# EAGLE design rp2040zero_display_encoder (EAGLE 6.2)
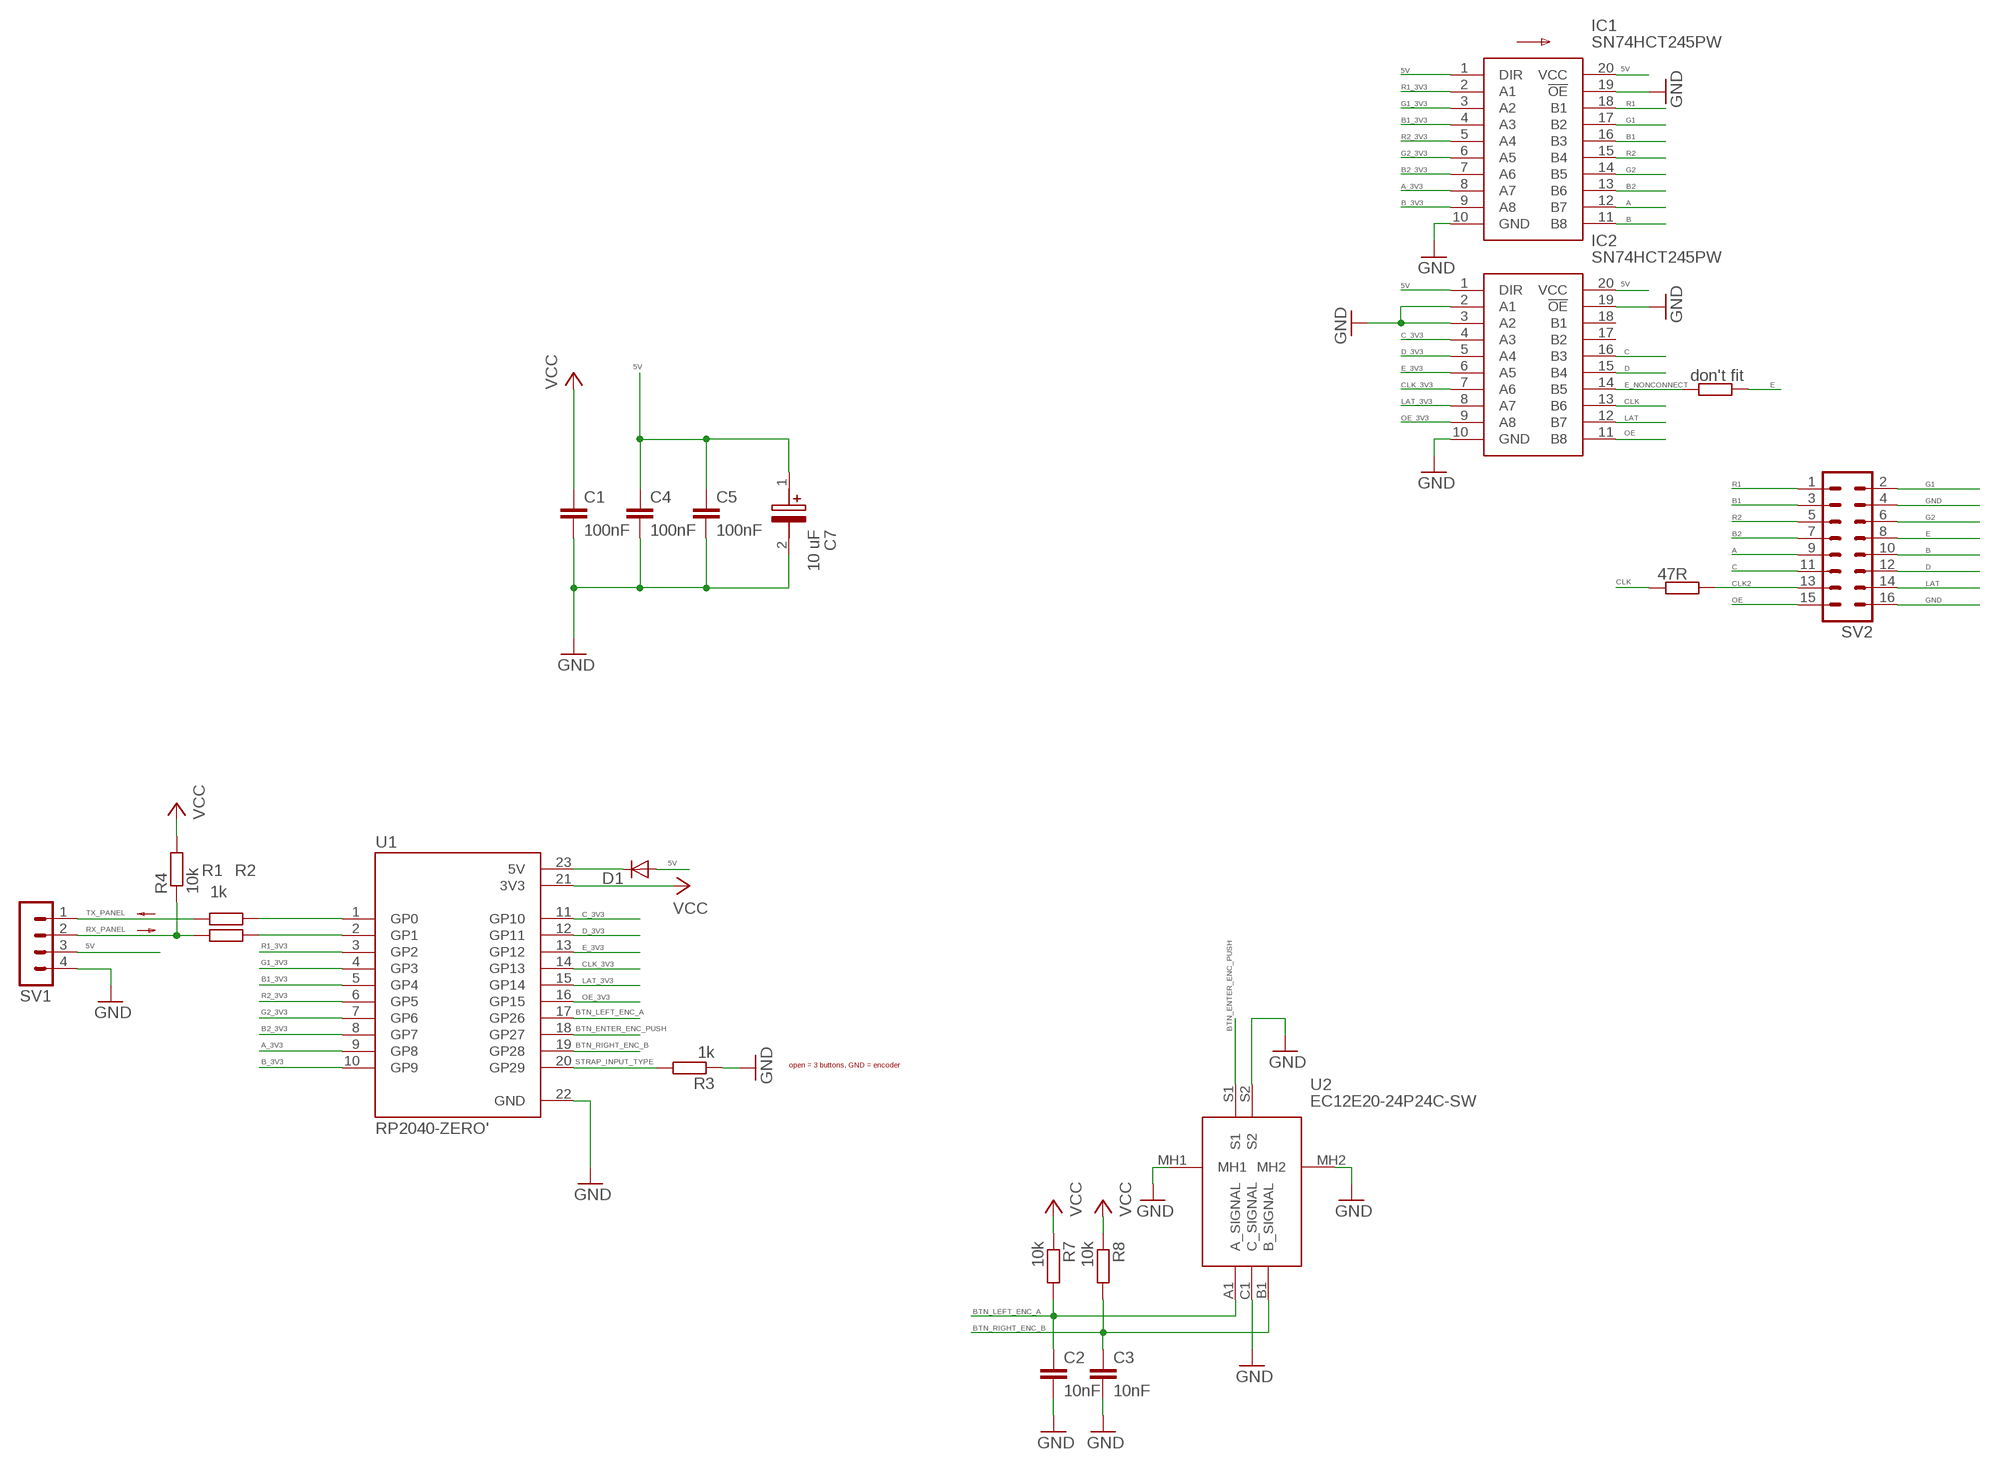
[diagram p0: schematic, sheet 1]

## Parts
C1  100nF  C-EUC0603  [C0603]
C2  10nF  C-EUC0603  [C0603]
C3  10nF  C-EUC0603  [C0603]
C4  100nF  C-EUC0603  [C0603]
C5  100nF  C-EUC0603  [C0603]
C7  10 uF  293D106X9016B2TE3  [CAPPM3528X210N]
D1  SK110-DIO  DIODE-DO214AC  [DO214AC]
IC1  SN74HCT245PW  [SOP65P640X120-20N]
IC2  SN74HCT245PW  [SOP65P640X120-20N]
R1  1k  R-EU_R0603  [R0603]
R2  1k  R-EU_R0603  [R0603]
R3  1k  R-EU_R0603  [R0603]
R4  10k  R-EU_R0603  [R0603]
R5  don't fit  R-EU_R0603  [R0603]
R6  47R  R-EU_R0603  [R0603]
R7  10k  R-EU_R0603  [R0603]
R8  10k  R-EU_R0603  [R0603]
SV1  MA04-1  [MA04-1]
SV2  ML16  [ML16]
U1  RP2040-ZERO'  [MODULE_RP2040-ZERO]
U2  EC12E20-24P24C-SW  [EC12E2024P24CSW]

## Nets
5V: C4.1 C5.1 C7.1(+) D1.A IC1.1(DIR) IC1.20(VCC) IC2.1(DIR) IC2.20(VCC) SV1.3
A: IC1.12(B7) SV2.9
A_3V3: IC1.8(A7) U1.9(GP8)
B: IC1.11(B8) SV2.10
B1: IC1.16(B3) SV2.3
B1_3V3: IC1.4(A3) U1.5(GP4)
B2: IC1.13(B6) SV2.7
B2_3V3: IC1.7(A6) U1.8(GP7)
B_3V3: IC1.9(A8) U1.10(GP9)
BTN_ENTER_ENC_PUSH: U1.18(GP27) U2.S1
BTN_LEFT_ENC_A: C2.1 R7.2 U1.17(GP26) U2.A1(A_SIGNAL)
BTN_RIGHT_ENC_B: C3.1 R8.2 U1.19(GP28) U2.B1(B_SIGNAL)
C: IC2.16(B3) SV2.11
C_3V3: IC2.4(A3) U1.11(GP10)
CLK: IC2.13(B6) R6.1
CLK2: R6.2 SV2.13
CLK_3V3: IC2.7(A6) U1.14(GP13)
D: IC2.15(B4) SV2.12
D_3V3: IC2.5(A4) U1.12(GP11)
E: R5.2 SV2.8
E_3V3: IC2.6(A5) U1.13(GP12)
E_NONCONNECT: IC2.14(B5) R5.1
G1: IC1.17(B2) SV2.2
G1_3V3: IC1.3(A2) U1.4(GP3)
G2: IC1.14(B5) SV2.6
G2_3V3: IC1.6(A5) U1.7(GP6)
GND: C1.2 C2.2 C3.2 C4.2 C5.2 C7.2(-) IC1.10(GND) IC1.19(!OE) IC2.2(A1) IC2.3(A2) IC2.10(GND) IC2.19(!OE) R3.1 SV1.4 SV2.4 SV2.16 U1.22(GND) U2.C1(C_SIGNAL) U2.MH1 U2.MH2 U2.S2
LAT: IC2.12(B7) SV2.14
LAT_3V3: IC2.8(A7) U1.15(GP14)
N$1: R1.2 U1.1(GP0)
N$2: R2.2 U1.2(GP1)
N$3: D1.C U1.23(5V)
OE: IC2.11(B8) SV2.15
OE_3V3: IC2.9(A8) U1.16(GP15)
R1: IC1.18(B1) SV2.1
R1_3V3: IC1.2(A1) U1.3(GP2)
R2: IC1.15(B4) SV2.5
R2_3V3: IC1.5(A4) U1.6(GP5)
RX_PANEL: R2.1 R4.1 SV1.2
STRAP_INPUT_TYPE: R3.2 U1.20(GP29)
TX_PANEL: R1.1 SV1.1
VCC: C1.1 R4.2 R7.1 R8.1 U1.21(3V3)
Unconnected: IC2.17(B2) IC2.18(B1)

## Notes on the sheet
- open = 3 buttons, GND = encoder

## Library data of the parts
C1-C5 = rcl:C-EU: CAPACITOR, European symbol
C7 = 293D106X9016B2TE3:293D106X9016B2TE3: Solid Tantalum Surface Mount Chip Capacitors TANTAMOUNT(TM), Molded Case, Standard Industrial Grade Source: Datasheet <http://www.vishay.com/docs/40002/293d.pdf>; DESCRIPTION: Solid Tantalum Surface Mount Chip Capacitors TANTAMOUNT(TM), Molded Case, Standard Industrial Grade; HEIGHT: 2.1mm; MANUFACTURER_NAME: Vishay; MANUFACTURER_PART_NUMBER: 293D106X9016B2TE3
D1 = diode:DIODE-: DIODE
IC1 IC2 = SN74HCT245PW:SN74HCT245PW: Texas Instruments SN74HCT245PW, Bus Transceiver, 8-Bit Non-Inverting CMOS, 5V, 20-Pin TSSOP Source: Datasheet <http://www.ti.com/lit/gpn/sn74hct245>; DESCRIPTION: Texas Instruments SN74HCT245PW, Bus Transceiver, 8-Bit Non-Inverting CMOS, 5V, 20-Pin TSSOP; HEIGHT: 1.2mm; MANUFACTURER_NAME: Texas Instruments; MANUFACTURER_PART_NUMBER: SN74HCT245PW
R1-R8 = resistor:R-EU_: RESISTOR, European symbol
SV1 = con-lstb:MA04-1: PIN HEADER; OC_FARNELL: unknown; OC_NEWARK: unknown
SV2 = con-ml:ML16: HARTING; OC_FARNELL: unknown; OC_NEWARK: unknown
U1 = RP2040-ZERO:RP2040-ZERO: Check availability <https://pricing.snapeda.com/parts/RP2040-ZERO/Waveshare%20Electronics/view-part?ref=eda>; AVAILABILITY: Not in stock; CHECK_PRICES: https://www.snapeda.com/parts/RP2040-ZERO/Waveshare+Electronics/view-part/?ref=eda; DESCRIPTION: Low-Cost, High-Performance Pico-Like MCU Board Based On Raspberry Pi Microcontroller RP2040; MF: Waveshare Electronics; MP: RP2040-ZERO; PACKAGE: Package; PRICE: None; SNAPEDA_LINK: https://www.snapeda.com/parts/RP2040-ZERO/Waveshare+Electronics/view-part/?ref=snap
U2 = EC12E20-24P24C-SW:EC12E20-24P24C-SW: Encoder: incremental; THT; 24imp/revol; Pos: 24; two phase A and B Source: Datasheet <https://www.tme.eu/Document/3355ee49dae2859b0bf824db7ca698f7/EC12E20-24P24C-SW.pdf>; DESCRIPTION: Encoder: incremental; THT; 24imp/revol; Pos: 24; two phase A and B; HEIGHT: 20mm; MANUFACTURER_NAME: SRPASSIVES; MANUFACTURER_PART_NUMBER: EC12E20-24P24C-SW

## Board
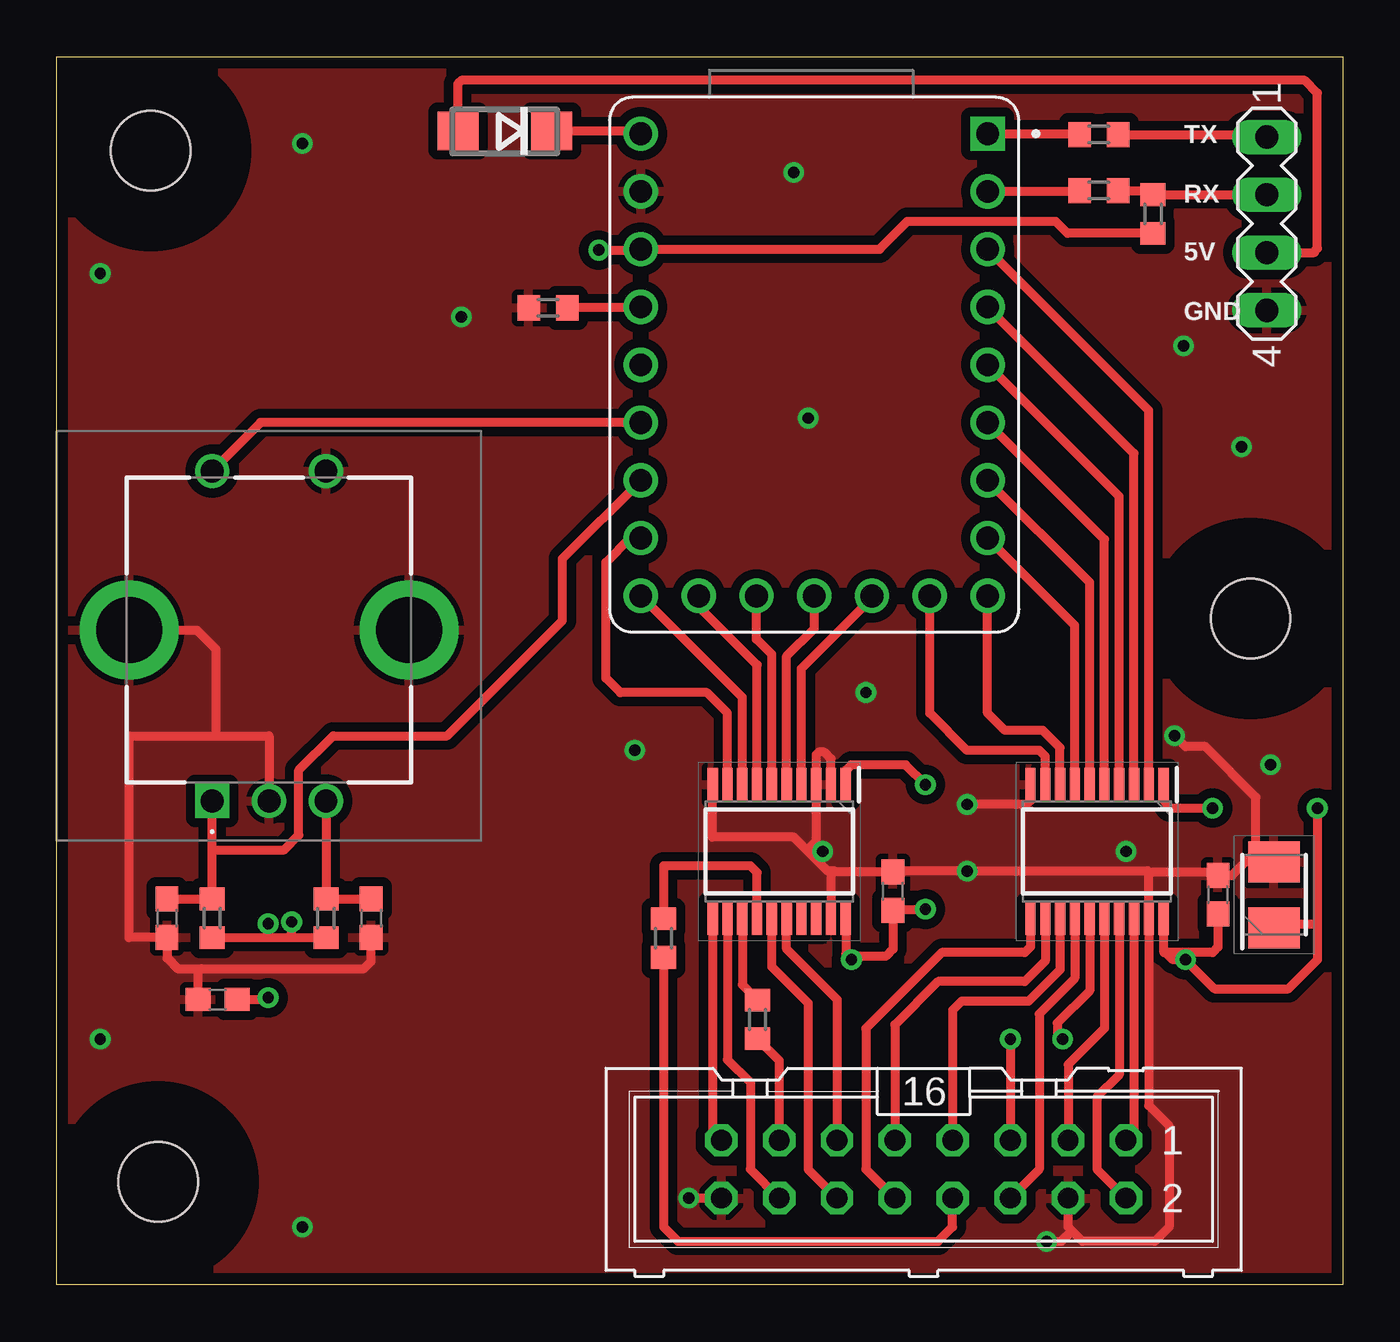
[diagram p1: board, top side]
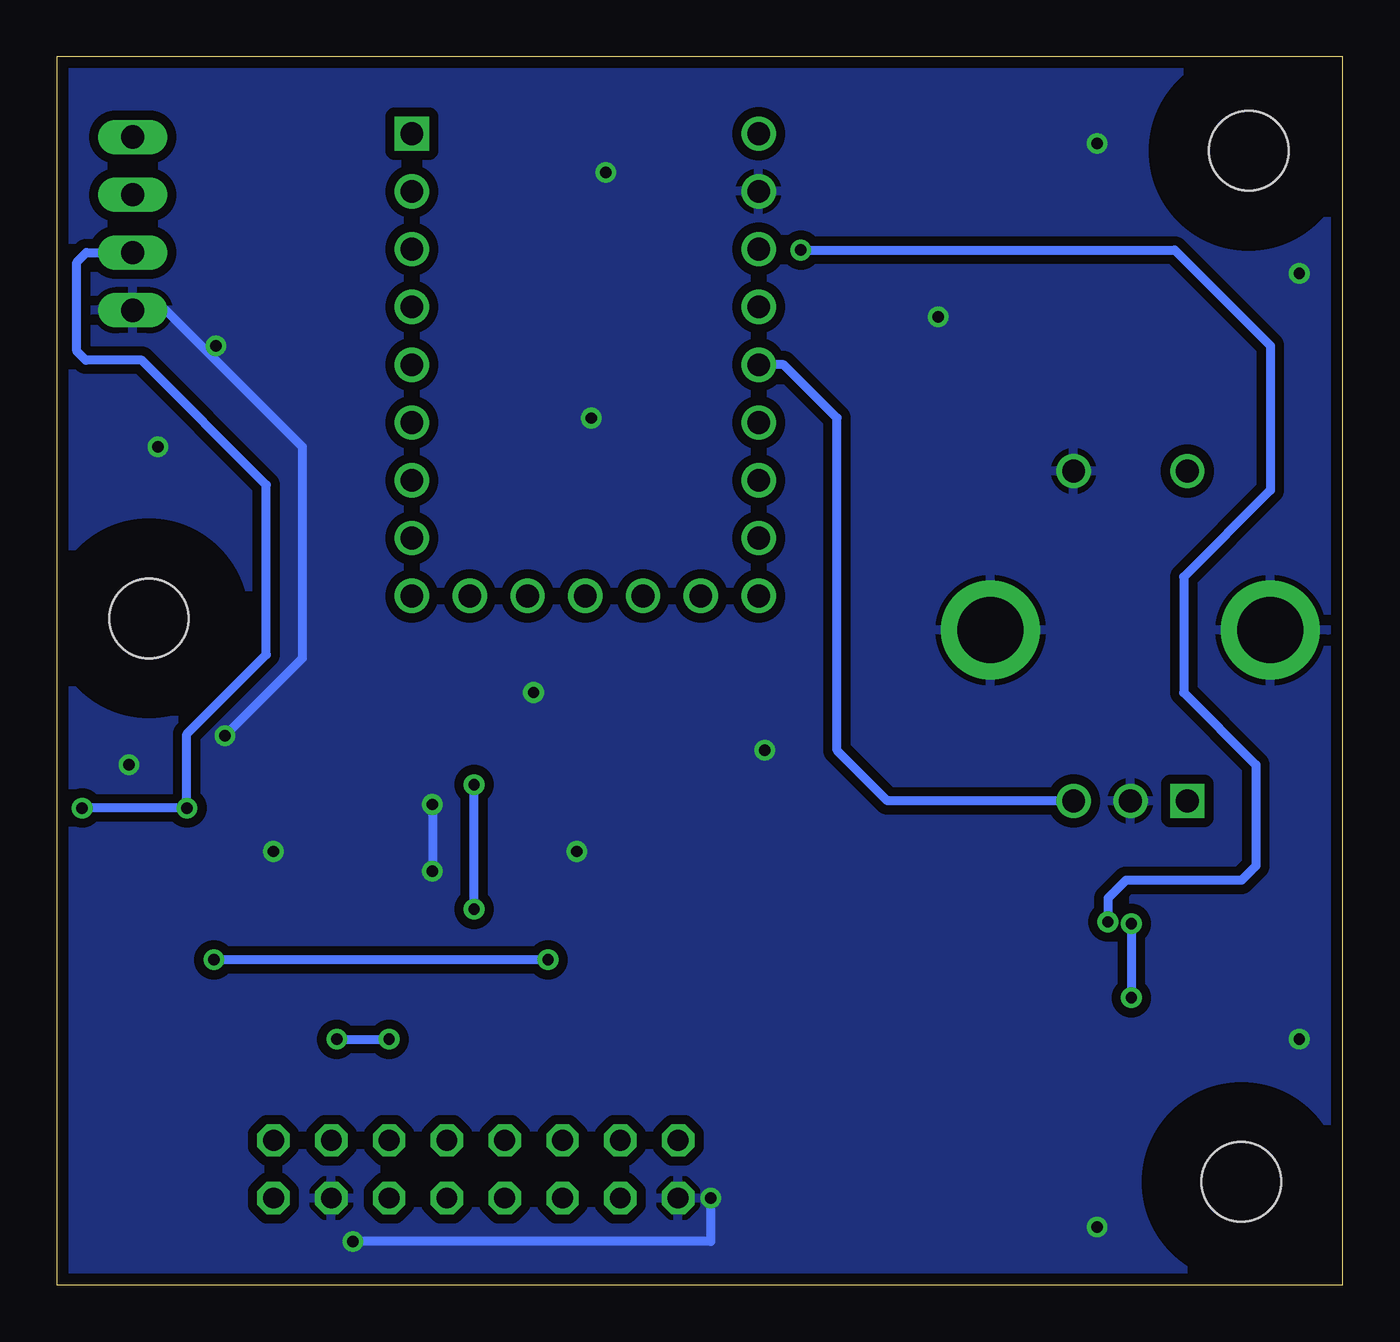
[diagram p2: board, bottom side, seen from below]

Size 56.52 x 53.98 mm. Coordinates in mm from the lower left corner, seen from the top.
Outline: 0,53.98 56.52,53.98 56.52,0 0,0 0,53.98
Copper layers (1*16): Top 0.035mm / dielectric 1.5mm / Bottom 0.035mm
Design rules: minimum track width 0.2mm, minimum drill 0.5mm, track to track 0.2mm, track to pad 0.2mm, pad to pad 0.2mm, via to via 0.2mm, smd to smd 0.2mm, copper to edge 0.5mm, drill to drill 8mil, minimum pad ring 10mil, minimum via ring 8mil, stop-mask expansion 4mil, vias tented up to drill 0mil, thermal gap 10mil
Holes 3.5 mm at 4.45,4.52 4.13,49.85 52.47,29.29
tRestrict: area 0.6,0.7 to 8.3,8.3; area 0.3,46 to 7.9,53.7; area 48.7,25.5 to 56.3,33.1
bRestrict: area 0.7,0.8 to 8.2,8.3; area 0.4,46.1 to 7.9,53.6; area 48.7,25.5 to 56.2,33.1

### Footprints (pad centres in the part's own frame; a part is rotated, then mirrored left to right if it is on the bottom)
C0603 = smd 1.1 x 1: 1 -0.85,0; 2 0.85,0
CAPPM3528X210N = smd 1.8 x 2.25: 1 -1.45,0; 2 1.45,0
DO214AC = smd 1.8 x 1.7: A 2.05,0; C -2.05,0
SOP65P640X120-20N = smd 1.475 x 0.45: 1 -2.938,2.925; 2 -2.938,2.275; 3 -2.938,1.625; 4 -2.938,0.975; 5 -2.938,0.325; 6 -2.938,-0.325; 7 -2.938,-0.975; 8 -2.938,-1.625; 9 -2.938,-2.275; 10 -2.938,-2.925; 11 2.938,-2.925; 12 2.938,-2.275; 13 2.938,-1.625; 14 2.938,-0.975; 15 2.938,-0.325; 16 2.938,0.325; 17 2.938,0.975; 18 2.938,1.625; 19 2.938,2.275; 20 2.938,2.925
R0603 = smd 1 x 1.1: 1 -0.85,0; 2 0.85,0
MA04-1 = drill 1.016 long: 1 -3.81,0; 2 -1.27,0; 3 1.27,0; 4 3.81,0
ML16 = drill 0.914 octagon: 1 -8.89,-1.27; 2 -8.89,1.27; 3 -6.35,-1.27; 4 -6.35,1.27; 5 -3.81,-1.27; 6 -3.81,1.27; 7 -1.27,-1.27; 8 -1.27,1.27; 9 1.27,-1.27; 10 1.27,1.27; 11 3.81,-1.27; 12 3.81,1.27; 13 6.35,-1.27; 14 6.35,1.27; 15 8.89,-1.27; 16 8.89,1.27
MODULE_RP2040-ZERO = drill 1 square: 1 7.62,10.16 | drill 1: 2 7.62,7.62; 3 7.62,5.08; 4 7.62,2.54; 5 7.62,0; 6 7.62,-2.54; 7 7.62,-5.08; 8 7.62,-7.62; 9 7.62,-10.16; 10 5.08,-10.16; 11 2.54,-10.16; 12 0,-10.16; 13 -2.54,-10.16; 14 -5.08,-10.16; 15 -7.62,-10.16; 16 -7.62,-7.62; 17 -7.62,-5.08; 18 -7.62,-2.54; 19 -7.62,0; 20 -7.62,2.54; 21 -7.62,5.08; 22 -7.62,7.62; 23 -7.62,10.16
EC12E2024P24CSW = drill 1 pad 1.5 square: A1 0,0 | drill 1 pad 1.5: B1 5,0; C1 2.5,0; S1 0,14.5; S2 5,14.5 | drill 2.9 pad 4.35: MH1 -3.65,7.5; MH2 8.65,7.5

### Placement (x,y rotation side)
C1  7.06,12.54 180 top
C2  4.84,16.11 270 top
C3  13.81,16.11 270 top
C4  36.75,17.3 90 top
C5  51.04,17.14 90 top
C7  53.5,17.14 90 top
D1  19.68,50.72 180 top
IC1  45.72,19.05 270 top
IC2  31.75,19.05 270 top
R1  45.8,50.56 180 top
R2  45.8,48.1 180 top
R3  21.59,42.94 0 top
R4  48.18,47.07 270 top
R5  26.67,15.24 270 top
R6  30.8,11.67 270 top
R7  6.83,16.11 90 top
R8  11.83,16.11 90 top
SV1  53.18,46.64 270 top
SV2  38.1,5.08 180 top
U1  33.29,40.44 0 top
U2  6.83,21.27 0 top

### Tracks (layer width: path | path; a pad name or v marks a point on that pad's centre or on a via)
5V  (via drill 0.5)
  Top 0.406: 55.27,45.37 SV1.3 55.22,45.37 55.4,45.56 55.4,52.39 54.85,52.94 17.78,52.94 17.62,52.78 17.62,50.73 D1.A | v55.4,20.95 55.4,15.88 | 55.4,15.88 55.4,14.29 54.13,13.02 50.88,13.02 v49.61,14.29 49.05,14.29 48.66,14.68 | 48.66,14.68 48.66,14.61 50.8,14.61 51.04,14.84 C5.1 | 48.66,14.68 48.66,16.1 IC1.20 | IC2.20 34.67,14.54 | 34.67,14.54 34.67,14.29 34.83,14.45 36.43,14.45 36.75,14.76 C4.1 36.75,16.51 v38.18,16.51 | 34.67,14.54 v34.92,14.29 | C7.1 53.68,15.88 55.4,15.88 | v38.18,21.99 37.31,22.86 34.92,22.86 34.67,22.61 IC2.1 | IC1.1 48.65,21.34 48.9,20.95 v50.8,20.95
  Bottom 0.406: v34.92,14.29 v49.61,14.29 | v38.18,16.51 v38.18,21.99 | v55.4,20.95 v50.8,20.95 50.8,24.21 47.31,27.7 47.31,35.16 52.78,40.64 55.24,40.64 55.64,41.04 55.64,44.95 55.22,45.37 SV1.3
A
  Top 0.406: IC1.12 43.45,14.23 42.55,13.34 38.73,13.34 36.83,11.43 SV2.9
A_3V3
  Top 0.406: IC1.8 44.09,23.61 43.34,24.37 41.67,24.37 40.91,25.13 U1.9
B
  Top 0.406: IC1.11 42.8,14.86 42.55,14.61 38.89,14.61 35.56,11.27 35.56,5.08 SV2.10
B1
  Top 0.406: IC1.16 46.05,11.28 44.45,9.68 SV2.3
B1_3V3
  Top 0.406: IC1.4 46.7,34.66 U1.5
B2
  Top 0.406: IC1.13 44.09,13.85 42.7,12.46 39.77,12.46 39.37,12.06 SV2.7
B2_3V3
  Top 0.406: IC1.7 44.74,28.99 U1.8
B_3V3
  Top 0.406: IC1.9 43.45,23.23 43.18,23.5 40.01,23.5 38.37,25.13 U1.10
BTN_ENTER_ENC_PUSH
  Top 0.406: U1.18 8.96,37.9 U2.S1
BTN_LEFT_ENC_A
  Top 0.406: C2.1 R7.2 6.83,19.12 | 6.83,19.12 U2.A1 | 6.83,19.12 9.99,19.12 10.64,19.76 10.64,22.62 12.14,24.13 17.14,24.13 22.23,29.21 22.23,31.92 U1.17
BTN_RIGHT_ENC_B
  Top 0.406: U2.B1 R8.2 C3.1
  Bottom 0.406: U2.B1 20,21.27 22.23,23.5 22.23,38.1 24.57,40.44 U1.19
C
  Top 0.406: SV2.11 34.29,12.54 32.08,14.76 IC2.16
C_3V3
  Top 0.406: IC2.4 32.73,27.09 35.83,30.19 U1.11
CLK
  Top 0.406: IC2.13 30.12,13.19 R6.1
CLK2
  Top 0.406: R6.2 31.75,9.87 SV2.13
CLK_3V3
  Top 0.406: IC2.7 30.77,27.25 28.21,29.81 U1.14
D
  Top 0.406: SV2.12 33.02,5.08 33.02,12.38 31.43,13.98 IC2.15
D_3V3
  Top 0.406: IC2.5 32.08,27.63 33.29,28.84 U1.12
E
  Top 0.406: R5.2 26.67,2.54 27.3,1.91 38.73,1.91 39.37,2.54 SV2.8
E_3V3
  Top 0.406: IC2.6 31.43,27.71 30.75,28.39 U1.13
E_NONCONNECT
  Top 0.406: IC2.14 30.77,18.12 30.48,18.41 26.67,18.41 R5.1
G1
  Top 0.406: IC1.17 46.7,9.23 45.72,8.26 45.72,5.08 SV2.2
G1_3V3
  Top 0.406: IC1.3 47.34,36.55 U1.4
G2
  Top 0.406: IC1.14 44.74,13.47 43.18,11.91 43.18,5.08 SV2.6
G2_3V3
  Top 0.406: IC1.6 45.4,30.88 U1.7
GND  (via drill 0.5)
  Top 0.406: 47.99,18.15 IC1.19 47.99,7.88 48.9,6.99 48.9,2.54 48.26,1.91 45.09,1.91 44.61,2.38 | 6.99,24.13 3.17,24.13 3.17,15.26 C2.2 4.84,14.37 5.32,13.89 6.35,13.89 | 6.99,24.13 9.33,24.13 U2.C1 | 5.08,28.77 6.15,28.77 6.99,27.94 6.99,24.13 | 6.35,13.89 13.49,13.89 13.81,14.21 C3.2 | IC2.10 28.81,21.98 28.81,19.68 32.38,19.68 32.98,19.09 | 34.15,18.2 34.02,18.07 IC2.19 | 44.61,2.38 44.45,2.54 SV2.4 | 34.15,18.2 33.87,18.2 32.98,19.09 | SV2.16 v27.78,3.81 | v43.5,1.91 44.13,1.91 44.61,2.38 | 40.01,18.2 47.94,18.2 47.99,18.15 | IC1.10 42.8,21.28 42.62,21.11 v40.01,21.11 | v40.01,18.18 40.01,18.2 | 47.99,18.15 50.83,18.15 C5.2 51.65,18 52.7,19.05 | 40.01,18.2 36.8,18.2 C4.2 34.2,18.15 34.15,18.2 | C7.2 53.04,19.05 52.7,19.05 | IC2.2 34.02,23.12 33.73,23.42 33.5,23.42 33.38,23.29 IC2.3 33.38,19.48 32.98,19.09 | C1.2 6.21,13.76 6.35,13.89 | 52.7,19.05 52.7,21.43 50.48,23.65 49.61,23.65 v49.13,24.13
  Bottom 0.406: v27.78,3.81 27.78,1.91 v43.5,1.91 | v40.01,21.11 v40.01,18.18 | v49.13,24.13 45.72,27.54 45.72,36.83 51.72,42.83 SV1.4
  other vias: 33.02,38.1 17.78,42.55 49.53,41.27 52.07,36.83 53.34,22.86 46.99,19.05 33.66,19.05 1.91,44.45 10.79,50.16 1.91,10.79 10.79,2.54 35.56,26.04 25.4,23.5 32.38,48.9
  pour Top (isolate 0.406): 0,53.98 56.52,53.98 56.52,0 0,0
  pour Bottom (isolate 0.406): 0,53.98 56.52,53.98 56.52,0 0,0
LAT
  Top 0.406: IC2.12 29.48,9.89 30.48,8.89 30.48,5.08 SV2.14
LAT_3V3
  Top 0.406: IC2.8 30.12,25.83 U1.15
N$1
  Top 0.406: U1.1 44.91,50.6 R1.2
N$2
  Top 0.406: U1.2 44.91,48.06 R2.2
N$3
  Top 0.406: D1.C 25.55,50.72 U1.23
OE
  Top 0.406: IC2.11 28.82,6.74 SV2.15
OE_3V3
  Top 0.406: IC2.9 29.48,25.14 28.57,26.04 24.77,26.04 24.13,26.67 24.13,31.75 25.2,32.82 U1.16
R1
  Top 0.406: IC1.18 47.34,6.71 SV2.1
R1_3V3
  Top 0.406: IC1.2 47.99,38.44 U1.3
R2  (via drill 0.5)
  Top 0.406: IC1.15 45.4,12.93 43.97,11.51 43.97,10.79 v44.21,10.79 | v41.91,10.79 SV2.5
  Bottom 0.406: v44.21,10.79 v41.91,10.79
R2_3V3
  Top 0.406: IC1.5 46.05,32.77 U1.6
RX_PANEL
  Top 0.406: R2.1 48,48.1 R4.1 SV1.2
STRAP_INPUT_TYPE
  Top 0.406: U1.20 25.63,42.94 R3.2
TX_PANEL
  Top 0.406: R1.1 53.07,50.56 SV1.1
VCC  (via drill 0.5)
  Top 0.406: R7.1 9.34,15.26 | 9.34,15.26 10.31,15.26 | 10.31,15.26 R8.1 | 9.34,15.26 9.29,15.32 v9.29,15.88 | C1.1 9.21,12.54 v9.29,12.62 | R4.2 44.43,46.22 43.89,46.75 37.39,46.75 36.16,45.52 U1.21 25.63,45.48 v23.81,45.48 | 10.31,15.26 v10.31,15.95 v10.32,15.95
  Bottom 0.406: v9.29,15.88 v9.29,12.62 | v23.81,45.48 7.38,45.48 3.17,41.27 3.17,34.92 6.99,31.11 6.99,26.04 3.81,22.86 3.81,18.41 4.45,17.78 9.53,17.78 10.32,16.99 v10.32,15.95

### Text on the board
tNames: TX | RX | 5V | GND